# Altium schematic sheet Peripherals.SchDoc
size A4; SheetNumber: 4; SheetTotal: 5
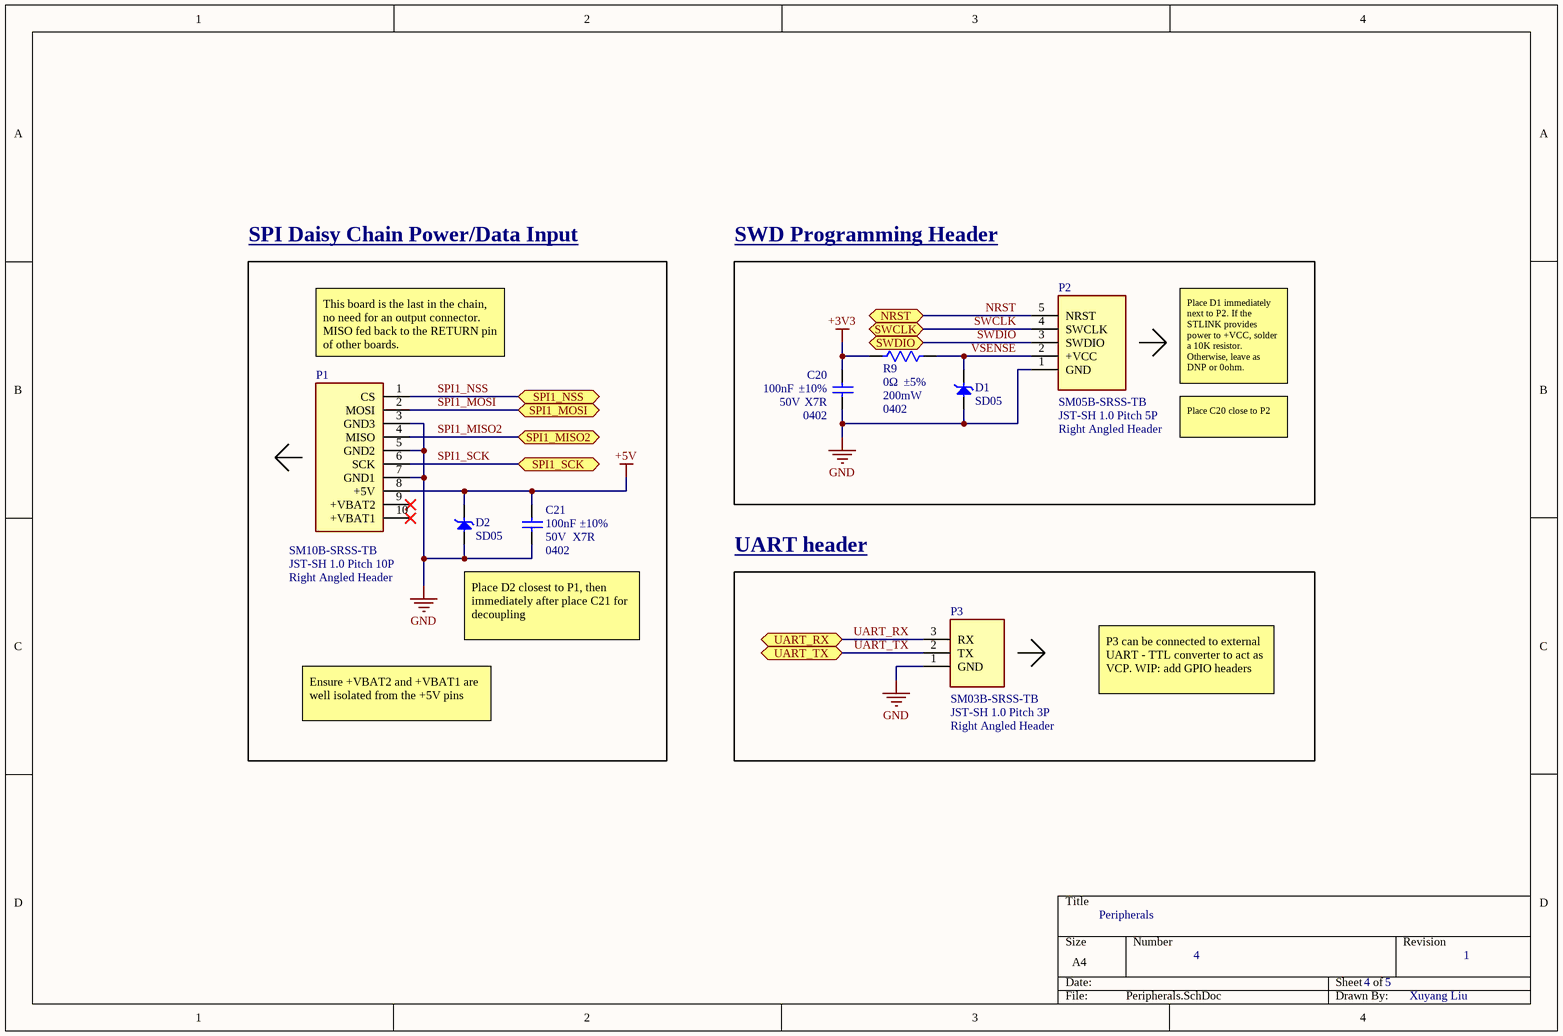
[diagram p0: Peripherals.SchDoc]

## Parts
C20  Case/Package: 0402  Voltage Rating: 50V  Dielectric: X7R  Tolerance: ±10%  [0402_Cap]  (hidden comment: 100nF)
C21  Case/Package: 0402  Voltage Rating: 50V  Dielectric: X7R  Tolerance: ±10%  [0402_Cap]  (hidden comment: 100nF)
D1  SD05  [DIO_MM3Z3V0T1G]
D2  SD05  [DIO_MM3Z3V0T1G]
P1  SM10B-SRSS-TB  [SM10B-SRSS-TB]
P2  SM05B-SRSS-TB  [SM05B-SRSS-TB]
P3  SM03B-SRSS-TB  [SM03B-SRSS-TB]
R9  Tolerance: ±5%  Power Rating: 200mW  Case/Package: 0402  Resistance: 0Ω  [0402_RES]  (hidden comment: 0R)

## Blocks framed on the sheet
SPI Daisy Chain Power/Data Input: C21 D2 P1
SWD Programming Header: C20 D1 P2 R9
UART header: P3

## Ports
NRST (bidir), SPI1_MISO2 (bidir), SPI1_MOSI (bidir), SPI1_NSS (bidir), SPI1_SCK (bidir), SWCLK (bidir), SWDIO (bidir), UART_RX (bidir), UART_TX (bidir)

## Nets
+3V3: C20.2 R9.1
+5V: C21.2 D2.K P1.8(+5V)
GND: C20.1 C21.1 D1.A D2.A P1.3(GND3) P1.5(GND2) P1.7(GND1) P2.1(GND) P3.1(GND)
NRST: P2.5(NRST) ; port NRST
SPI1_MISO2: P1.4(MISO) ; port SPI1_MISO2
SPI1_MOSI: P1.2(MOSI) ; port SPI1_MOSI
SPI1_NSS: P1.1(CS) ; port SPI1_NSS
SPI1_SCK: P1.6(SCK) ; port SPI1_SCK
SWCLK: P2.4(SWCLK) ; port SWCLK
SWDIO: P2.3(SWDIO) ; port SWDIO
UART_RX: P3.3(RX) ; port UART_RX
UART_TX: P3.2(TX) ; port UART_TX
VSENSE: D1.K P2.2(+VCC) R9.2

Not connected (* = marked no-connect by the designer): P1 9(+VBAT2)* 10(+VBAT1)*

## Notes on the sheet
- (near P1) This board is the last in the chain, no need for an output connector. MISO fed back to the RETURN pin of other boards.
- Place D1 immediately next to P2. If the STLINK provides power to +VCC, solder a 10K resistor. Otherwise, leave as DNP or 0ohm.
- (near P2) JST-SH 1.0 Pitch 5P
- Right Angled Header
- Place C20 close to P2
- JST-SH 1.0 Pitch 10P
- Place D2 closest to P1, then immediately after place C21 for decoupling
- Ensure +VBAT2 and +VBAT1 are well isolated from the +5V pins
- (near P3) JST-SH 1.0 Pitch 3P
- P3 can be connected to external UART - TTL converter to act as VCP. WIP: add GPIO headers
- Peripherals
- 4
- 4     5
- 1
- Xuyang Liu

## Library data of the parts
C20 C21 = GCM155R71H104KE02J: 50V 100nF X7R ±10% 0402 Multilayer Ceramic Capacitors MLCC - SMD/SMT ROHS; Manufacturer: Murata; Manufacturer Lifecycle Status: IN PRODUCTION; Supplier 1: DigiKey; Manufacturer Part Number: GCM155R71H104KE02J; RoHS: Compliant; Category: Ceramic Capacitors; Stock 1: 13930662; Pricing 1: 1=0.1, 10=0.034, 50=0.0226, 100=0.0193, 500=0.01374, 1000=0.01205, 2500=0.01027, 5000=0.0092 (USD); Case Code (Imperial): 0402; Case Code (Metric): 1005; Country of Origin: Philippines; Dielectric Material: Ceramic; Export Control Classification Number (ECCN) Code: EAR99; Height: 500µm; Harmonized Tariff Schedule (HTS) Code: 8532.24.00.20; Introduction Date: 2013-11-20; Length: 1mm; Lifecycle Status: Production; Material: Ceramic; Max Operating Temperature: 125°C; Min Operating Temperature: -55°C; Mount: Surface Mount; Number of Terminals: 2; Packaging: Tape & Reel (TR); Ratings: AEC-Q200; REACH SVHC: Yes; Schedule B: 8532240020, 8532240020|8532240020, 8532240020|8532240020|8532240020, 8532240020|8532240020|8532240020|8532240020; Termination: SMD/SMT; Voltage Rating (DC): 50V; Weight: 6.010099mg; Width: 500µm; ComponentLink1URL: https://datasheet.octopart.com:443/GCM155R71H104KE02J-Murata-datasheet-155345015.pdf?src-supplier=Newark; ComponentLink1Description: https://datasheet.octopart.com:443/GCM155R71H104KE02J-Murata-datasheet-155345015.pdf?src-supplier=Newark; ComponentLink2URL: https://datasheet.octopart.com:443/GCM155R71H104KE02J-Murata-datasheet-178519985.pdf?src-supplier=Arrow.cn; ComponentLink2Description: https://datasheet.octopart.com:443/GCM155R71H104KE02J-Murata-datasheet-178519985.pdf?src-supplier=Arrow.cn; ComponentLink3URL: https://datasheet.octopart.com:443/GCM155R71H104KE02J-Murata-datasheet-141266224.pdf?src-supplier=Ciiva; ComponentLink3Description: https://datasheet.octopart.com:443/GCM155R71H104KE02J-Murata-datasheet-141266224.pdf?src-supplier=Ciiva; ComponentLink4URL: https://datasheet.octopart.com:443/GCM155R71H104KE02J-Murata-datasheet-140656751.pdf?src-supplier=Ciiva; ComponentLink4Description: https://datasheet.octopart.com:443/GCM155R71H104KE02J-Murata-datasheet-140656751.pdf?src-supplier=Ciiva; ComponentLink5URL: https://datasheet.octopart.com:443/GCM155R71H104KE02J-Murata-datasheet-138716456.pdf?src-supplier=Ciiva; ComponentLink5Description: https://datasheet.octopart.com:443/GCM155R71H104KE02J-Murata-datasheet-138716456.pdf?src-supplier=Ciiva; ComponentLink6URL: https://datasheet.octopart.com:443/GCM155R71H104KE02J-Murata-datasheet-77992203.pdf?src-supplier=Future+Electronics; ComponentLink6Description: https://datasheet.octopart.com:443/GCM155R71H104KE02J-Murata-datasheet-77992203.pdf?src-supplier=Future+Electronics; ComponentLink7URL: https://datasheet.octopart.com:443/GCM155R71H104KE02J-Murata-datasheet-12511495.pdf?src-supplier=TME; ComponentLink7Description: https://datasheet.octopart.com:443/GCM155R71H104KE02J-Murata-datasheet-12511495.pdf?src-supplier=TME; ComponentLink8URL: http://sigma.octopart.com:80/reach_statement/Murata-company-16.pdf?src-supplier=Compliance+Statements; ComponentLink8Description: http://sigma.octopart.com:80/reach_statement/Murata-company-16.pdf?src-supplier=Compliance+Statements; Supplier Part Number 1: 490-14514-6-ND; Capacitance: 100nF
D1 D2 = SD05: Trans Voltage Suppressor Diode, 350W, 5V V(RWM), Unidirectional, 1 Element, Silicon; Manufacturer: Sangdest Microelectronics; Clamping Voltage: 14.5V; Min Breakdown Voltage: 6V; Number of Elements: 1; Peak Reverse Current: 10µA; Supplier 1: DigiKey; Manufacturer Part Number: SD05; RoHS: Compliant; Category: TVS Diodes; Stock 1: 13210; Pricing 1: 1=0.27, 10=0.165, 100=0.1025, 500=0.0752, 1000=0.06636 (USD); Lifecycle Status: Production; Max Operating Temperature: 125°C; Min Operating Temperature: -55°C; Number of Terminals: 2; Peak Pulse Power: 350W; Polarity: Unidirectional; REACH SVHC: Yes; Reverse Standoff Voltage: 5V; ComponentLink1URL: https://datasheet.octopart.com:443/SD05-SMC-Diode-Solutions-datasheet-181400473.pdf?src-supplier=IHS; ComponentLink1Description: https://datasheet.octopart.com:443/SD05-SMC-Diode-Solutions-datasheet-181400473.pdf?src-supplier=IHS; Supplier Part Number 1: 1655-SD05CT-ND
P1 = SM10B-SRSS-TB_1: Board Connector, 10 Contact(s), 1 Row(s), Male, Right Angle, Surface Mount Terminal; Manufacturer: JST; Connector Type: Male Pin; Number of Contacts: 10; Pitch: 990.6µm; Supplier 1: DigiKey; Manufacturer Part Number: SM10B-SRSS-TB; RoHS: Compliant; Category: Card Edge Connectors; Stock 1: 3469; Pricing 1: 1=0.93, 10=0.788, 100=0.6694, 500=0.59746, 1000=0.56894 (USD); Color: Natural; Contact Plating: Tin; Export Control Classification Number (ECCN) Code: EAR99; Gender: Male; Housing Color: Natural; Housing Material: Nylon; Harmonized Tariff Schedule (HTS) Code: 8536.69.40.40; Introduction Date: 1996-04-01; Lead Free: Contains Lead; Lifecycle Status: Obsolete; Mount: Surface Mount; Number of Pins: 10; Number of Positions: 10; Number of Rows: 1; Orientation: Right Angle; Terminal Pitch: 1mm; Termination: Solder; ComponentLink1URL: https://datasheet.octopart.com:443/SM10B-SRSS-TB-JST-datasheet-180492086.pdf?src-supplier=IHS; ComponentLink1Description: https://datasheet.octopart.com:443/SM10B-SRSS-TB-JST-datasheet-180492086.pdf?src-supplier=IHS; ComponentLink2URL: https://datasheet.octopart.com:443/SM10B-SRSS-TB-JST-datasheet-118603.pdf?src-supplier=DigiKey; ComponentLink2Description: https://datasheet.octopart.com:443/SM10B-SRSS-TB-JST-datasheet-118603.pdf?src-supplier=DigiKey
P2 = SM05B-SRSS-TB-SWD: Board Connector, 5 Contact(s), 1 Row(s), Male, Right Angle, Surface Mount Terminal; Manufacturer: JST; Connector Type: Male Pin; Number of Contacts: 5; Pitch: 990.6µm; Supplier 1: DigiKey; Manufacturer Part Number: SM05B-SRSS-TB; RoHS: Compliant; Category: Card Edge Connectors; Stock 1: 42194; Pricing 1: 1=0.62, 10=0.527, 100=0.4477, 500=0.3996, 1000=0.38051 (USD); Color: Natural; Contact Plating: Tin; Export Control Classification Number (ECCN) Code: EAR99; Gender: Male; Housing Color: Natural; Housing Material: Nylon; Harmonized Tariff Schedule (HTS) Code: 8536.69.40.40; Introduction Date: 1996-04-01; Lead Free: Contains Lead; Lifecycle Status: Obsolete; Mount: Surface Mount; Number of Positions: 5; Number of Rows: 1; Orientation: Right Angle; Terminal Pitch: 1mm; Termination: Solder; ComponentLink1URL: https://datasheet.octopart.com:443/SM05B-SRSS-TB-JST-datasheet-180492086.pdf?src-supplier=IHS; ComponentLink1Description: https://datasheet.octopart.com:443/SM05B-SRSS-TB-JST-datasheet-180492086.pdf?src-supplier=IHS; ComponentLink2URL: https://datasheet.octopart.com:443/SM05B-SRSS-TB-JST-datasheet-118603.pdf?src-supplier=DigiKey; ComponentLink2Description: https://datasheet.octopart.com:443/SM05B-SRSS-TB-JST-datasheet-118603.pdf?src-supplier=DigiKey; ComponentLink3URL: https://datasheet.octopart.com:443/SM05B-SRSS-TB-JST-datasheet-152738602.pdf?src-supplier=Amar+Radio+Corporation; ComponentLink3Description: https://datasheet.octopart.com:443/SM05B-SRSS-TB-JST-datasheet-152738602.pdf?src-supplier=Amar+Radio+Corporation
P3 = SM03B-SRSS-TB_UART: Board Connector, 3 Contact(s), 1 Row(s), Male, Right Angle, Surface Mount Terminal; Manufacturer: JST; Connector Type: Male Pin; Number of Contacts: 3; Pitch: 990.6µm; Supplier 1: DigiKey; Manufacturer Part Number: SM03B-SRSS-TB; RoHS: Compliant; Category: Card Edge Connectors; Stock 1: 14167; Pricing 1: 1=0.44, 10=0.373, 100=0.317, 500=0.2829, 1000=0.26938 (USD); Color: Natural; Contact Gender: Male; Contact Plating: Tin; Housing Color: Natural; Housing Material: Nylon; Lead Free: Contains Lead; Lifecycle Status: Obsolete; Max Operating Temperature: 85°C; Min Operating Temperature: -25°C; Mount: Surface Mount; Number of Pins: 3; Number of Positions: 3; Number of Rows: 1; Orientation: Horizontal; Terminal Pitch: 1mm; Termination: Solder; ComponentLink1URL: https://datasheet.octopart.com:443/SM03B-SRSS-TB-JST-datasheet-180492086.pdf?src-supplier=IHS; ComponentLink1Description: https://datasheet.octopart.com:443/SM03B-SRSS-TB-JST-datasheet-180492086.pdf?src-supplier=IHS; ComponentLink2URL: https://datasheet.octopart.com:443/SM03B-SRSS-TB-JST-datasheet-44103209.pdf?src-supplier=TME; ComponentLink2Description: https://datasheet.octopart.com:443/SM03B-SRSS-TB-JST-datasheet-44103209.pdf?src-supplier=TME; ComponentLink3URL: https://datasheet.octopart.com:443/SM03B-SRSS-TB-JST-datasheet-118603.pdf?src-supplier=DigiKey; ComponentLink3Description: https://datasheet.octopart.com:443/SM03B-SRSS-TB-JST-datasheet-118603.pdf?src-supplier=DigiKey; ComponentLink4URL: https://datasheet.octopart.com:443/SM03B-SRSS-TB-JST-datasheet-152738602.pdf?src-supplier=Amar+Radio+Corporation; ComponentLink4Description: https://datasheet.octopart.com:443/SM03B-SRSS-TB-JST-datasheet-152738602.pdf?src-supplier=Amar+Radio+Corporation
R9 = RCS04020000Z0ED: 0Ω Resistor, Jumper, 0402 [1005 Metric], Thick Film, 200 mW, 3 A, Surface Mount Device; Manufacturer: Vishay; Max Current Rating: 3A; Voltage Rating: 50V; Supplier 1: DigiKey; Manufacturer Part Number: RCS04020000Z0ED; RoHS: Compliant; Category: Chip SMD Resistors; Stock 1: 775160; Pricing 1: 1=0.1, 10=0.032, 25=0.0268, 50=0.0232, 100=0.0204, 250=0.01728, 500=0.01532, 1000=0.01364, 5000=0.01064 (USD); Case Code (Imperial): 0402; Case Code (Metric): 1005; China RoHS: Non-Compliant; Composition: Thick Film; Country of Origin: Israel, Mainland China; Export Control Classification Number (ECCN) Code: EAR99; Features: Automotive AEC-Q200; Height: 350µm; Harmonized Tariff Schedule (HTS) Code: 8533.21.00.30; Introduction Date: 2016-07-12; Length: 1mm; Lifecycle Status: Production; Max Operating Temperature: 155°C; Max Power Dissipation: 200mW; Min Operating Temperature: -55°C; Mount: Surface Mount; Number of Terminals: 2; Number of Terminations: 2; Ratings: AEC-Q200; REACH SVHC: Yes; Voltage Rating (DC): 50V; Width: 500µm; ComponentLink1URL: https://datasheet.octopart.com:443/RCS04020000Z0ED-Vishay-datasheet-176436275.pdf?src-supplier=IHS; ComponentLink1Description: https://datasheet.octopart.com:443/RCS04020000Z0ED-Vishay-datasheet-176436275.pdf?src-supplier=IHS; ComponentLink2URL: https://datasheet.octopart.com:443/RCS04020000Z0ED-Vishay-datasheet-86813749.pdf?src-supplier=Future+Electronics; ComponentLink2Description: https://datasheet.octopart.com:443/RCS04020000Z0ED-Vishay-datasheet-86813749.pdf?src-supplier=Future+Electronics; ComponentLink3URL: http://sigma.octopart.com:80/rohs_statement/Vishay-company-15.pdf?src-supplier=Compliance+Statements; ComponentLink3Description: http://sigma.octopart.com:80/rohs_statement/Vishay-company-15.pdf?src-supplier=Compliance+Statements; Supplier Part Number 1: 541-2877-6-ND